# EasyEDA Pro project climbsnail-spotwelder-45c7d2f7.epro, schematic SpotWelder_Mini
Create Date: 2024-03-07; Page Name: P1; Project Name: SpotWelderDev; Schematic Name: SpotWelder_Mini; Update Date: 2024-10-01; Company: 嘉立创EDA; Page Size: A4; Version: V1.0
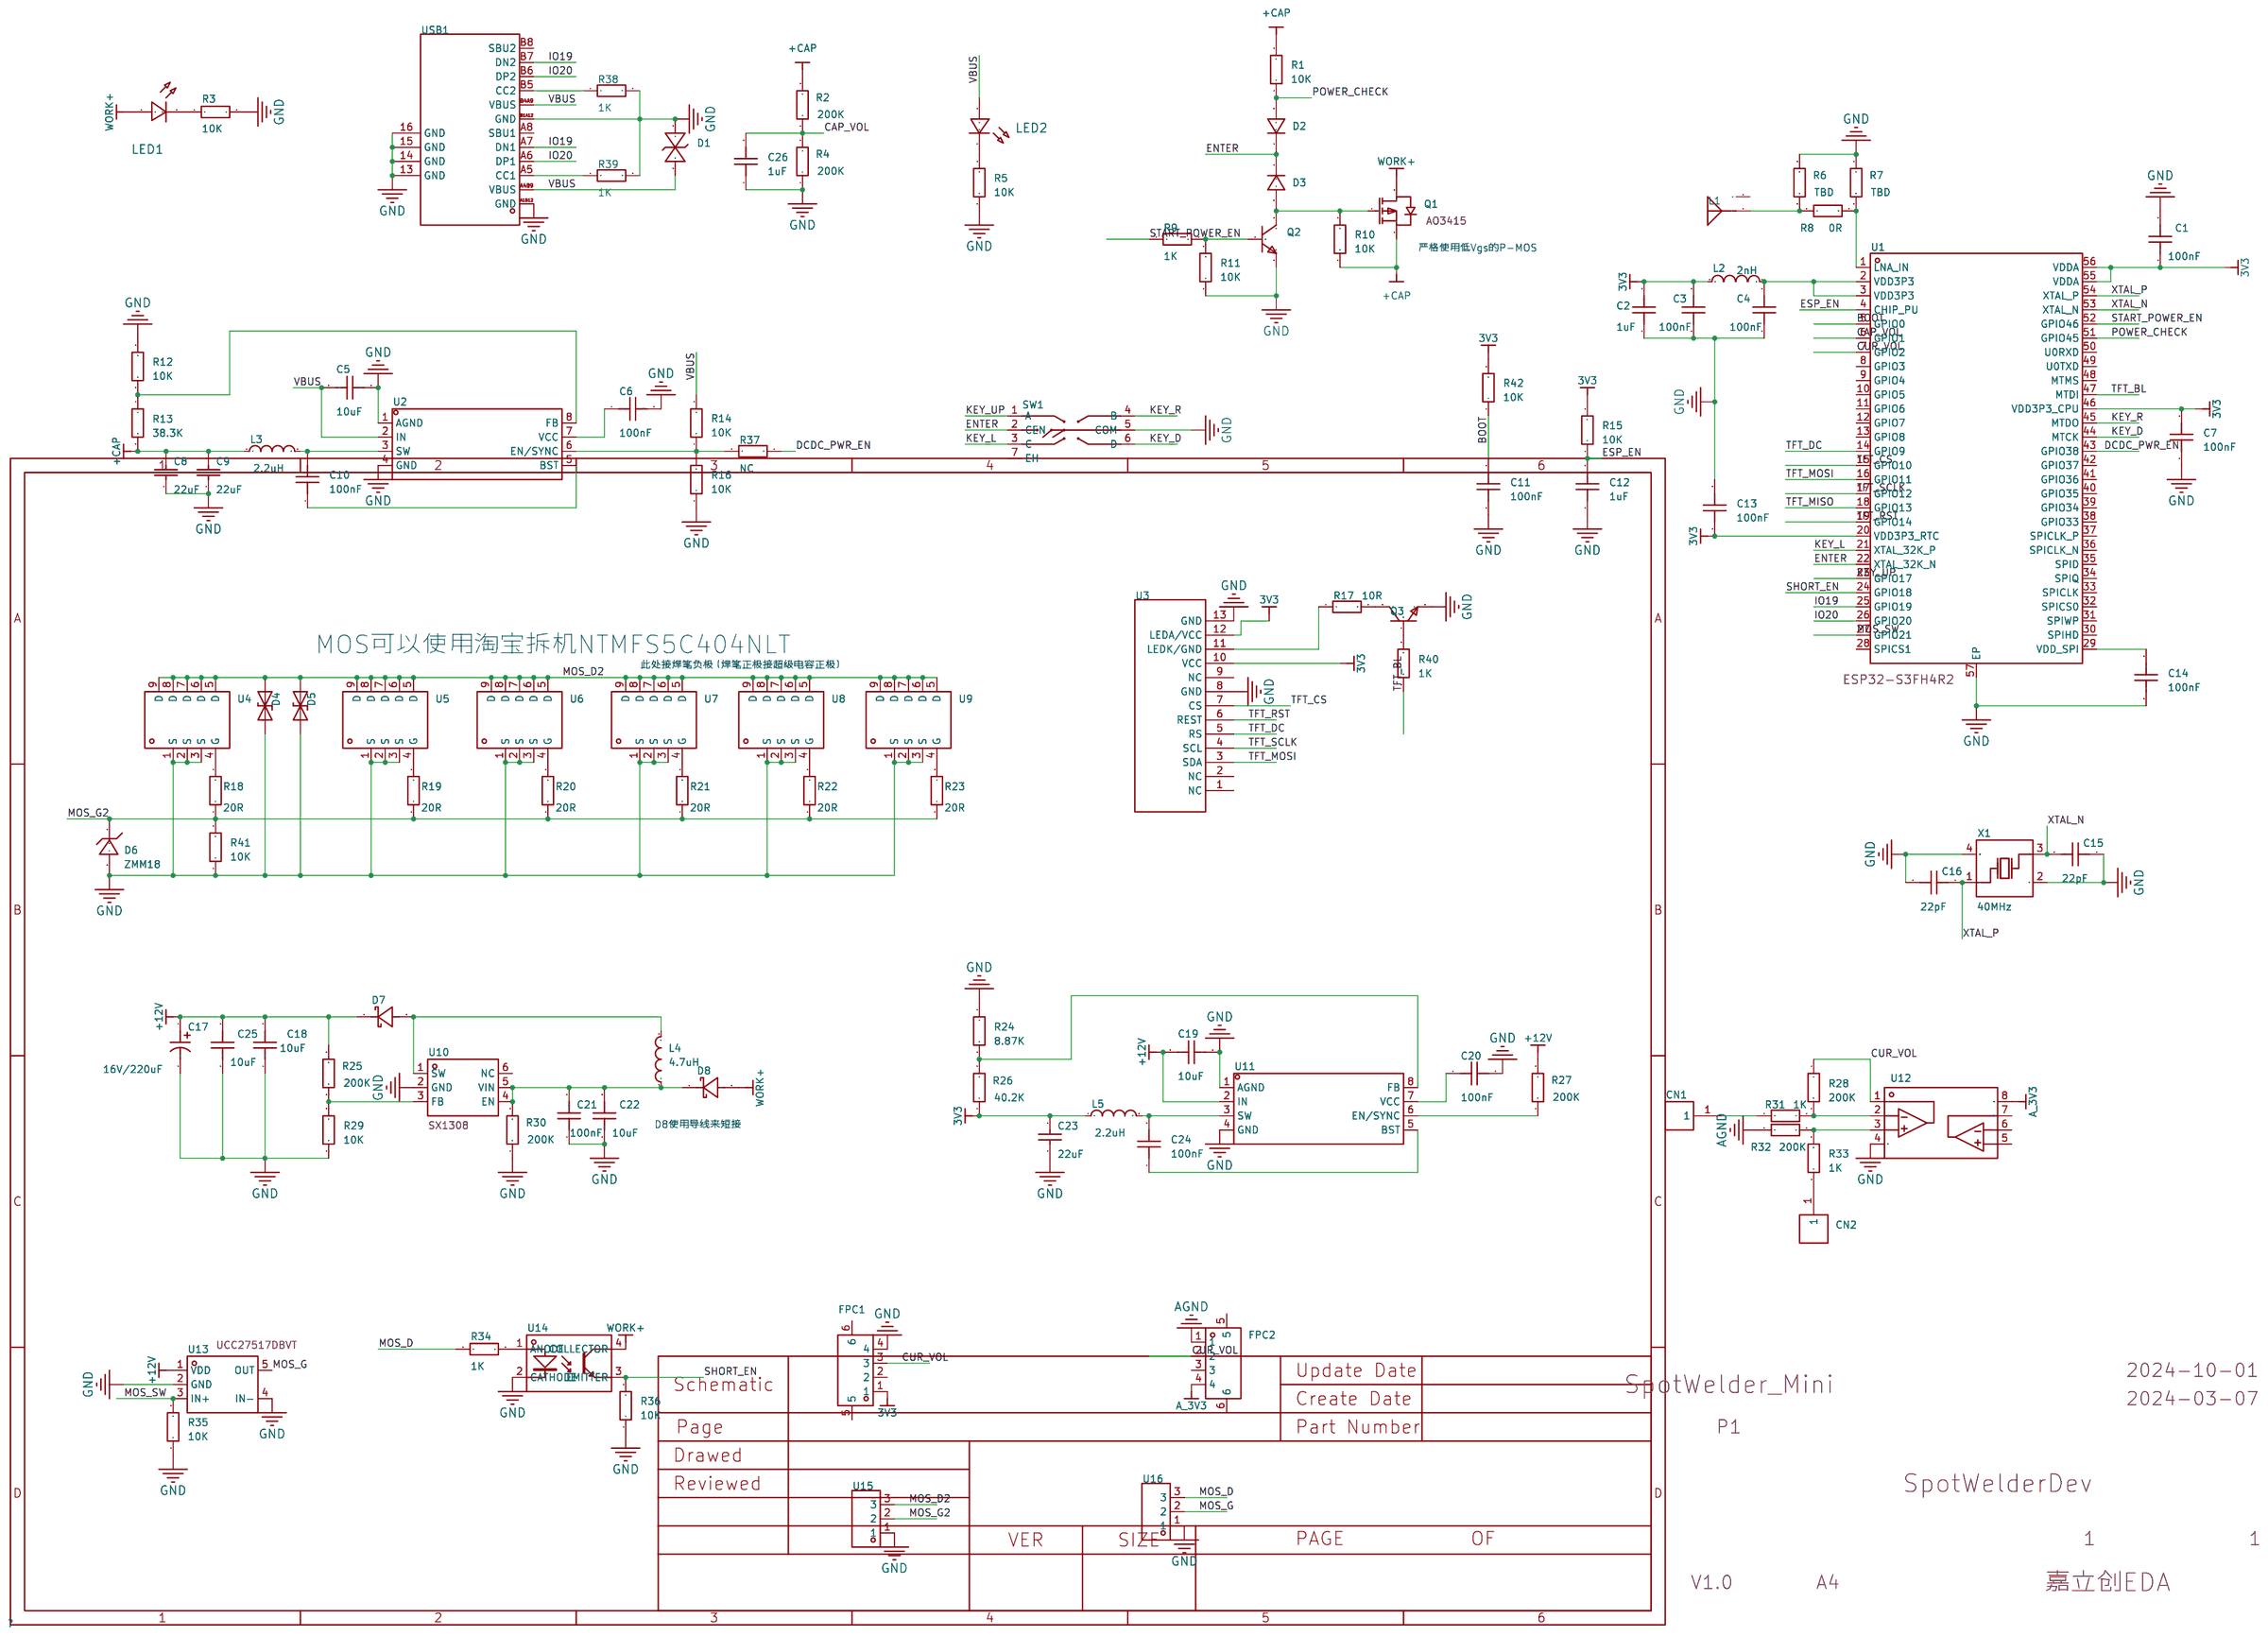
[diagram p0: schematic sheet]

## Parts
C1  100nF  [C0402]
C2  1uF  [C0603]
C3  100nF  [C0402]
C4  100nF  [C0402]
C5  10uF  [C0603]
C6  100nF  [C0402]
C7  100nF  [C0402]
C8  22uF  [C1206]
C9  22uF  [C1206]
C10  100nF  [C0402]
C11  100nF  [C0402]
C12  1uF  [C0402]
C13  100nF  [C0402]
C14  100nF  [C0402]
C15  22pF  [C0603]
C16  22pF  [C0603]
C17  16V/220uF  [CAP-SMD_BD6.3-L6.6-W6.6-FD]
C18  10uF  [C0603]
C19  10uF  [C0603]
C20  100nF  [C0402]
C21  100nF  [C0402]
C22  10uF  [C0603]
C23  22uF  [C1206]
C24  100nF  [C0402]
C25  10uF  [C0603]
C26  1uF  [C0402]
CN1  5006  [TH_BD3.2-D2.0]
CN2  5006  [TH_BD3.2-D2.0]
D1  SMBJ5.0CA  [SMB_L4.6-W3.6-LS5.3-BI]
D2  1N4148WS  [SOD-323_L1.8-W1.3-LS2.5-RD]
D3  1N4148WS  [SOD-323_L1.8-W1.3-LS2.5-RD]
D4  SMBJ28CA双向TVS管  [SMB_L4.6-W3.6-LS5.3-BI]
D5  SMBJ28CA双向TVS管  [SMB_L4.6-W3.6-LS5.3-BI]
D6  ZMM18  [LL-34_L3.5-W1.5-RD]
D7  SS34  [SMA_L4.3-W2.6-LS5.2-RD]
D8  SS34  [SMA_L4.3-W2.6-LS5.2-RD]
FPC1  X05A12H04G  [FPC-SMD_4P-P0.50_XKB_X05A12H04G]
FPC2  X05A12H04G  [FPC-SMD_4P-P0.50_XKB_X05A12H04G]
L1  AN2051-245  [ANT2051]
L2  2nH  [L0402]
L3  2.2uH  [IND-SMD_L4.2-W4.2-C133189]
L4  4.7uH  [IND-SMD_L4.5-W4.0-1]
L5  2.2uH  [IND-SMD_L4.2-W4.2-C133189]
LED1  -  [LED0603-RD_BLUE]
LED2  -  [LED0603-RD_BLUE]
Q1  AO3415  [SOT-23-3_L2.9-W1.3-P1.90-LS2.4-BR]
Q2  S8050 J3Y  [SOT-23-3_L3.0-W1.7-P0.95-LS2.9-BR]
Q3  S8050  [SOT-23-3_L2.9-W1.3-P1.90-LS2.4-BR]
R1  10K  [R0402]
R2  200K  [R0402]
R3  10K  [R0402]
R4  200K  [R0402]
R5  10K  [R0402]
R6  TBD  [R0402]
R7  TBD  [R0402]
R8  0R  [R0402]
R9  1K  [R0603]
R10  10K  [R0402]
R11  10K  [R0402]
R12  10K  [R0402]
R13  38.3K  [R0603]
R14  10K  [R0402]
R15  10K  [R0402]
R16  10K  [R0402]
R17  10R  [R0603]
R18  20R  [R0603]
R19  20R  [R0603]
R20  20R  [R0603]
R21  20R  [R0603]
R22  20R  [R0603]
R23  20R  [R0603]
R24  8.87K  [R0603]
R25  200K  [R0402]
R26  40.2K  [R0402]
R27  200K  [R0402]
R28  200K  [R0402]
R29  10K  [R0402]
R30  200K  [R0402]
R31  1K  [R0603]
R32  200K  [R0402]
R33  1K  [R0603]
R34  1K  [R0603]
R35  10K  [R0402]
R36  10K  [R0402]
R37  NC  [R0402]
R38  1K  [R0603]
R39  1K  [R0603]
R40  1K  [R0603]
R41  10K  [R0402]
R42  10K  [R0402]
SW1  TM-4175-B-A  [SW-SMD_TM-4175-B-X]
U1  ESP32-S3FH4R2  [QFN-56_L7.0-W7.0-P0.40-TL-EP4.0]
U2  -  [TSOT-23-8_L2.9-W1.6-P0.65-LS2.8-BR]
U3  -  [1.14TFT焊接式B]
U4  NCEP30T21GU  [DFN-8_L5.8-W5.1-P1.27-LS5.9-BL]
U5  NCEP30T21GU  [DFN-8_L5.8-W5.1-P1.27-LS5.9-BL]
U6  NCEP30T21GU  [DFN-8_L5.8-W5.1-P1.27-LS5.9-BL]
U7  NCEP30T21GU  [DFN-8_L5.8-W5.1-P1.27-LS5.9-BL]
U8  NCEP30T21GU  [DFN-8_L5.8-W5.1-P1.27-LS5.9-BL]
U9  NCEP30T21GU  [DFN-8_L5.8-W5.1-P1.27-LS5.9-BL]
U10  SX1308  [SOT-23-6_L2.9-W1.6-P0.95-LS2.8-BR]
U11  -  [TSOT-23-8_L2.9-W1.6-P0.65-LS2.8-BR]
U12  GS8332-SR  [SOP-8_L4.9-W3.9-P1.27-LS6.0-BL]
U13  UCC27517DBVT  [SOT-23-5_L2.9-W1.6-P0.95-LS2.8-BR]
U14  CT185GB(T1)  [SOP-4_L4.4-W3.6-P2.54-LS7.0-TL]
U15  A2541WV-3P  [HDR-TH_3P-P2.54-V-M]
U16  A2541WV-3P  [HDR-TH_3P-P2.54-V-M]
USB1  TYPEC-304-BCP16  [USB-C-SMD_TYPEC-304-BCP16]
X1  40MHz  [OSC-SMD_4P-L3.2-W2.5-BL_SIT8008BI]

## Library data of the parts
C1 C3 C4 C6 C7 C10-C14 C20 C21 C24 C26 = CAP_0402: Supplier Footprint: 0402
C2 C5 C15 C16 C18 C19 C22 C25 = CAP_0603: 容值:100nF;精度:±10%;额定电压:50V;温度系数:X7R;; Supplier Footprint: 0603
C8 C9 C23 = CL31A226KAHNNNE: 容值:22uF;精度:±10%;额定电压:25V;材质(温度系数):X5R;; LCSC Part Name: 22uF ±10% 25V; Supplier Part: C12891; Manufacturer: SAMSUNG(三星); Supplier Footprint: 1206; JLCPCB Part Class: Basic Part; Datasheet: https://atta.szlcsc.com/upload/public/pdf/source/20160103/1457707667836.pdf; Supplier: LCSC; Tolerance: ±10%; Voltage Rated: 25V; Temperature Coefficient: X5R
C17 = RVT220UF10V67RV0037: 容值:220uF;额定电压:10V;电容体直径:-;电容体长度:-;纹波电流:-;等效串联电阻:-;工作寿命:2000hrs@105℃;; LCSC Part Name: 220uF 10V; Supplier Part: C2833309; Manufacturer: KNSCHA(科尼盛); Supplier Footprint: SMD,6.3x5.4mm; JLCPCB Part Class: 扩展库; Datasheet: https://atta.szlcsc.com/upload/public/pdf/source/20210521/C2833309_008BCE4BC4FC60DA08096FEE6338ABBD.pdf; Supplier: LCSC; Rated Voltage: 10V; Lifetime @ Temp: 2000hrs@105℃
CN1 CN2 = 5006_C2906764: 测试点; Supplier Part: C2906764; Manufacturer: Keystone; JLCPCB Part Class: 扩展库; Datasheet: https://atta.szlcsc.com/upload/public/pdf/source/20211115/64B944F8418AA2CF0680BB1B201435FB.pdf; Supplier: LCSC
D1 = SMBJ5.0CA_C726851: Supplier Part: C726851; Manufacturer: TWGMC(台湾迪嘉); Supplier Footprint: SMB; JLCPCB Part Class: 扩展库; Datasheet: https://atta.szlcsc.com/upload/public/pdf/source/20200901/C726811_07201DC3516E92FF13903A0BAE18F725.pdf; Supplier: LCSC
D2 D3 = 1N4148WS_C2128: 二极管配置:独立式;功率:200mW;直流反向耐压(Vr):100V;平均整流电流(Io):150mA;正向压降(Vf):1.25V@150mA;反向电流(Ir):1uA@75V;反向恢复时间(trr):4ns;工作温度:+150℃@(Tj);; LCSC Part Name: 100V 150mA 4ns T4; Supplier Part: C2128; Manufacturer: CJ(江苏长电/长晶); Supplier Footprint: SOD-323; JLCPCB Part Class: 基础库; Datasheet: https://atta.szlcsc.com/upload/public/pdf/source/20140809/1457707208178.pdf; Supplier: LCSC; Diode Configuration: 独立式; Power Dissipation: 200mW; Reverse Voltage (Vr): 100V; Average Rectified Current (Io): 150mA; Forward Voltage (Vf@If): 1.25V@150mA; Reverse Leakage Current: 1uA@75V; Reverse Recovery Time (trr): 4ns; Operating Temperature: +150℃@(Tj)
D4 D5 = SMBJ28CA双向TVS管: Pin Type: IN; Supplier: LCSC; Manufacturer Part: SMBJ28CA; Manufacturer: Brightking; Supplier Part: C78417; JLCPCB Part Class: Extended Part
D6 = ZMM18: 二极管配置:独立式;稳压值(标称值):18V;稳压值(范围):16.8V~19.1V;精度:-;功率:500mW;反向电流(Ir):100nA@13V;阻抗(Zzt):50Ω;; LCSC Part Name: 18V 500mW; Supplier Part: C8071; Manufacturer: ST(先科); Supplier Footprint: LL-34; JLCPCB Part Class: Extended Part; Datasheet: https://atta.szlcsc.com/upload/public/pdf/source/20120512/1457706507902.pdf; Supplier: LCSC; Diode Configuration: 独立式; Zener Voltage (Nom): 18V; Zener Voltage (Range): 16.8V~19.1V; Power Dissipation: 500mW; Reverse Leakage Current (Ir): 100nA@13V; Zener Impedance (Zzt): 50Ω
D7 D8 = SS34_C3032484: Supplier Part: C3032484; Manufacturer: TDD(台冠电子); Supplier Footprint: SMA; JLCPCB Part Class: Extended Part; Datasheet: https://atta.szlcsc.com/upload/public/pdf/source/20220622/9D70D0693761B542BF6F533590093AA5.pdf; Supplier: LCSC
FPC1 FPC2 = X05A12H04G: 间距:0.5mm;触点数量:4;锁定特性:翻盖式;安装类型:卧贴;触点类型:双侧触点/上下接;工作温度范围:-40℃~+85℃;焊接温度(最大值):260℃;; LCSC Part Name: 0.5mm P数:4 翻盖式 双侧触点/上下接; Supplier Part: C2880761; Manufacturer: XKB Connectivity(中国星坤); Supplier Footprint: SMD,P=0.5mm; Datasheet: https://atta.szlcsc.com/upload/public/pdf/source/20211011/7594ED4A8B21B39D6C2C07571E80F84E.pdf; Supplier: LCSC; Pitch: 0.5mm; Number of Contacts: 4; Locking Feature: 翻盖式; Mounting Type: 卧贴; Contact Type: 双侧触点/上下接; Height Above Board: 1.2mm; FFC, FCB Thickness: 0.3mm; Contact Material: 磷青铜; Contact Plating: 金; Operating Temperature Range: -40℃~+85℃; Welding Temperature (Max): 260℃
L1 = AN2051-245: 小体积，高增益，WIFI，蓝牙，zigBee 2.4G天线; Supplier Part: C99727; Manufacturer: rainsun(霖昱微); Supplier Footprint: 2051; JLCPCB Part Class: 扩展库; Datasheet: https://atta.szlcsc.com/upload/public/pdf/source/20170329/1490752053541.pdf; Supplier: LCSC
L2 = LQG15HS2N0S02D: 电感值:2nH;精度:±0.3nH;额定电流:900mA;饱和电流(Isat):-;直流电阻(DCR):90mΩ;; LCSC Part Name: 2nH ±0.3nH 90mΩ; Supplier Part: C18216; Manufacturer: muRata(村田); Supplier Footprint: 0402; JLCPCB Part Class: 扩展库; Datasheet: https://atta.szlcsc.com/upload/public/pdf/source/20190514/C18216_4C6D770518CF7A3B206943E09D2940CE.pdf; Supplier: LCSC; Tolerance: ±0.3nH; Rated Current: 900mA; DC Resistance (DCR): 90mΩ; Q @ Freq: 8@100MHz; Frequency - Self Resonant: 6GHz
L3 L5 = HA42-2R2MT: 电感值:2.2uH;精度:±20%;额定电流:3A;饱和电流(Isat):5A;直流电阻(DCR):58mΩ;; LCSC Part Name: 2.2uH ±20% 3A 58mΩ; Supplier Part: C2936650; Manufacturer: FH(风华); Supplier Footprint: 0420; JLCPCB Part Class: 扩展库; Datasheet: https://atta.szlcsc.com/upload/public/pdf/source/20211228/DF5AAD1C624D1DACD739A51BD94418BC.pdf; Supplier: LCSC; Tolerance: ±20%; Rated Current: 3A; Saturation Current (Isat): 5A; DC Resistance (DCR): 58mΩ
L4 = MCS0420-4R7MPN2: 电感值:4.7uH;精度:±20%;额定电流:2.2A;饱和电流(Isat):3.5A;直流电阻(DCR):98mΩ;; LCSC Part Name: 4.7uH ±20% 2.2A 98mΩ; Supplier Part: C2937092; Manufacturer: PSA(信昌电陶); Supplier Footprint: 0420; JLCPCB Part Class: Extended Part; Datasheet: https://atta.szlcsc.com/upload/public/pdf/source/20220121/BD01ABADD177E465ADC6F87339B1CE90.pdf; Supplier: LCSC; Tolerance: ±20%; Rated Current: 2.2A; Saturation Current (Isat): 3.5A; DC Resistance (DCR): 98mΩ
LED1 LED2 = LED_0603-R: 发光颜色:红灯;二极管配置:-;透镜颜色:无色透明;主波长:617.5nm;峰值波长:632nm;色温:-;光通量(25时):-;测试电流:5mA;正向电压(VF):2.2V;发光强度:28.5mcd;功率:60mW;发光角度:120°;安装方式:-;工作温度:-40~+85;; Supplier Footprint: 0603; Supplier Part: C72044
Q1 = AO3415_C181094: 类型:P沟道;漏源电压(Vdss):20V;连续漏极电流(Id):4A;功率(Pd):1.5W;导通电阻(RDS(on)@Vgs,Id):41mΩ@4.5V,4A;阈值电压(Vgs(th)@Id):900mV@250uA;; LCSC Part Name: P沟道 20V 4A; Supplier Part: C181094; Manufacturer: Hottech(合科泰); Supplier Footprint: SOT-23; JLCPCB Part Class: Extended Part; Datasheet: https://atta.szlcsc.com/upload/public/pdf/source/20180131/C181094_15173931965481329223.pdf; Supplier: LCSC; Type: P沟道; Drain Source Voltage (Vdss): 20V; Continuous Drain Current (Id): 4A; Power Dissipation (Pd): 1.5W; Drain Source On Resistance (RDS(on)@Vgs,Id): 41mΩ@4.5V,4A; Gate Threshold Voltage (Vgs(th)@Id): 900mV@250uA
Q2 = S8050 J3Y_C2146: 晶体管类型:NPN;集射极击穿电压(Vceo):25V;集电极电流(Ic):500mA;功率(Pd):300mW;集电极截止电流(Icbo):100nA;集电极-发射极饱和电压(VCE(sat)@Ic,Ib):600mV@500mA,50mA;直流电流增益(hFE@Ic,Vce):200@50mA,1V;特征频率(fT):150MHz;工作温度:+150℃@(Tj);; LCSC Part Name: NPN 25V 500mA (200-350); Supplier Part: C2146; Manufacturer: CJ(江苏长电/长晶); Supplier Footprint: SOT-23-3L; JLCPCB Part Class: 基础库; Datasheet: https://atta.szlcsc.com/upload/public/pdf/source/20140809/1457707209234.pdf; Supplier: LCSC; Transistor Type: NPN; Collector-Emitter Breakdown Voltage (Vceo): 25V; Collector Current (Ic): 500mA; Power Dissipation (Pd): 300mW; Collector Cut-Off Current (Icbo): 100nA; Collector-Emitter Saturation Voltage (VCE(sat)@Ic,Ib): 600mV@500mA,50mA; DC Current Gain (hFE@Ic,Vce): 200@50mA,1V; Transition Frequency (fT): 150MHz; Operating Temperature: +150℃@(Tj)
Q3 = S8050_C2891804: Supplier Part: C2891804; Manufacturer: YONGYUTAI(永裕泰); Supplier Footprint: SOT-23; JLCPCB Part Class: 扩展库; Datasheet: https://atta.szlcsc.com/upload/public/pdf/source/20210901/5347316A10609C628D4D69AE01446E5B.pdf; Supplier: LCSC
R1-R8 R10-R12 R14-R16 R25-R30 R32 R35-R37 R41 R42 = Res_0402: Supplier Footprint: 0402
R9 R13 R17-R24 R31 R33 R34 R38-R40 = Res_0603: Supplier Footprint: 0603
SW1 = TM-4175-B-A: 多功能开关 7.5*7.5*5 五向开关 H5; LCSC Part Name: 多功能开关 7.5*7.5*5 五向开关 H5; Supplier Part: C465995; Manufacturer: XKB Connectivity(中国星坤); Supplier Footprint: SMD-8P,7.5x7.5mm; JLCPCB Part Class: 扩展库; Datasheet: https://atta.szlcsc.com/upload/public/pdf/source/20211011/A0F6117F2AB0E02F6CF3847B7456F266.pdf; Supplier: LCSC
U1 = ESP32-S3: Supplier Part: C2913192; Manufacturer: ESPRESSIF(乐鑫); Supplier Footprint: QFN-56-EP(7x7); JLCPCB Part Class: 扩展库; Datasheet: https://atta.szlcsc.com/upload/public/pdf/source/20220211/8CA5C1C53CA8E3D1871752073201D38A.pdf; Supplier: LCSC
U2 U11 = MP2225GJ-Z: 最大输入电压:-;可输出电流:-;; Supplier Part: C133066; Supplier Footprint: TSOT-23-8; JLCPCB Part Class: 扩展库; Supplier: LCSC
U3 = 1.14TFT焊接式: Supplier: LCSC; Supplier Part: 1.14寸LCD; link: https://item.taobao.com/item.htm?spm=a1z09.2.0.0.71822e8drxlmENid=586638527978_u=v83q7ore291; Manufacturer: 中景园; Manufacturer Part: 1.14寸LCD
U4-U9 = NCEP30T21GU: Supplier Part: C502971; Manufacturer: NCE(无锡新洁能); Supplier Footprint: DFN5x6Clip-A; Supplier: LCSC
U10 = SX1308: 功能类型:升压型;同步整流:否;输出通道数:1;拓扑结构:升压式;输入电压:2V~24V;输出电压:28V;输出电流(最大值):-;开关频率:1.2MHz;; LCSC Part Name: 升压型 Vin=2V~24V Vout=28V; Supplier Part: C78162; Manufacturer: SX(硕芯科技); Supplier Footprint: SOT-23-6; JLCPCB Part Class: Extended Part; Datasheet: https://atta.szlcsc.com/upload/public/pdf/source/20160920/1474356679185.pdf; Supplier: LCSC; Function: 升压型; Synchronous Rectification: 否; Number of Outputs: 1; Topology: 升压式; Input Voltage: 2V~24V; Output Voltage: 28V; Switching Frequency: 1.2MHz
U12 = GS8332-SR: 运放类型:Zero-Drift;放大器组数:2;增益带宽积（GBP）:350KHz;压摆率（SR）:0.2 V/us;电源电压:2.1V ~ 5.5V;各通道供电电流:20uA;; LCSC Part Name: GS8332 SOP-8; Supplier Part: C157713; Manufacturer: Gainsil(聚洵); Supplier Footprint: SOP-8-150mil; JLCPCB Part Class: 扩展库; Datasheet: https://atta.szlcsc.com/upload/public/pdf/source/20200615/C605419_D70E1851DA800D34ADA08E397521FED7.pdf; Supplier: LCSC; Amplifier Type: Zero-Drift; Number of Circuits: 2; Gain Bandwidth Product（GBP）: 350KHz; Slew Rate（SR）: 0.2 V/us; Output Type: Rail-to-Rail; Supply Voltage（Single）: 2.1V ~ 5.5V; Iq per channel (Typ): 20uA; Operating Temperature: -40°C ~ 125°C
U13 = UCC27517DBVT: 采用 SOT-23 封装、具有 5V UVLO 和 13ns 传播延迟的 4A/4A 单通道栅极驱动器 5-SOT-23 -40 to 140; Supplier Part: C2877770; Manufacturer: TI(德州仪器); Supplier Footprint: SOT-23-5; JLCPCB Part Class: Extended Part; Supplier: LCSC
U14 = CT185GB(T1): 输入电压类型:DC;输出通道数:1;正向电压:1.24V;反向电压:6V;输出电流:50mA;接收端电压:80V;集射极饱和电压(Vce(sat)@Ic,IF):300mV@2.4mA,8mA;隔离电压(rms):3.75kV;; LCSC Part Name: DC输入 隔离电压(rms):3750V; Supplier Part: C191836; Manufacturer: CT MICRO; Supplier Footprint: SOP-4-2.54mm; JLCPCB Part Class: Extended Part; Datasheet: https://atta.szlcsc.com/upload/public/pdf/source/20180504/C191836_4B58AF92622DBE42072B31496F4BAFB3.pdf; Supplier: LCSC; Input voltage type: DC; Output Type: 光电三极管; Number of Outputs: 1; Forward Voltage: 1.24V; Reverse Voltage: 6V; Output Current: 50mA; Receiving End Voltage: 80V; Collector-Emitter Saturation Voltage (Vce(sat)@Ic,IF): 300mV@2.4mA,8mA; Rise time: 5us@2mA,100Ω; Fall time: 9us@2mA,100Ω; Isolation Voltage(rms): 3.75kV; Operating Temperature: -55℃~+110℃; Pin Name: COLLECTOR
U15 U16 = A2541WV-3P_1: Supplier Part: C5295980; Manufacturer: CJT(长江连接器); Supplier Footprint: 插件,P=2.54mm; Datasheet: https://atta.szlcsc.com/upload/public/pdf/source/20190522/C339348_148DC62DFEE35B66DE27661541078F4A.pdf; Supplier: LCSC
USB1 = TYPEC-304-BCP16_C720629: 连接器类型:Type-C;标准:USB 3.1;公母:母座;触点数量:16;端口数量:1;安装方式:卧贴;额定电流 - 电源:3A;工作温度范围:-25~+85;焊接温度(最大值):260;; LCSC Part Name: Type-C 母座 卧贴 停产 停产; Supplier Part: C720629; Manufacturer: XUNPU(讯普); Supplier Footprint: SMD; JLCPCB Part Class: Extended Part; Datasheet: https://atta.szlcsc.com/upload/public/pdf/source/20220210/1FE0FEFF7D6A20C111212527D3DED014.pdf; Supplier: LCSC; Connector Type: Type-C; Standard: USB 3.1; Gender: 母座; Number of Contacts: 16; Number of Ports: 1; Mounting Style: 卧贴; Current Rating - Power (Max): 3A; Operating Temperature Range: -25~+85; Welding Temperature (Max): 260
X1 = X322540MPB4SI: 晶振类型:贴片无源晶振;频率:40MHz;频率公差:±10ppm;频率稳定度:±30ppm;负载电容:15pF;工作温度:-40℃~+85℃;; LCSC Part Name: 40MHz ±10ppm 15pF; Supplier Part: C9010; Manufacturer: YXC扬兴科技; Supplier Footprint: SMD3225-4P; JLCPCB Part Class: 扩展库; Datasheet: https://atta.szlcsc.com/upload/public/pdf/source/20210329/C112971_1F611BDC486E193C1706F6D8EB5AA189.pdf; Supplier: LCSC; Crystal Type: 贴片无源晶振; Frequency Tolerance: ±10ppm; Frequency Stability: ±30ppm; Load Capacitance: 15pF; Operating Temperature: -40℃~+85℃

## Nets
3V3: C1.1 C2.2 C3.2 C7.2 C13.1 C23.2 FPC1.1 L2.1 L5.1 R15.2 R26.1 R42.2 U1.20(VDD3P3_RTC) U1.46(VDD3P3_CPU) U1.55(VDDA) U1.56(VDDA) U3.10(VCC) U3.12(LEDA/VCC)
+12V: C17.1 C18.2 C19.2 C25.2 D7.1(K) R25.2 R27.2 U11.2(IN) U13.1(VDD)
AGND: FPC2.1 R32.2
GND: C1.2 C2.1 C3.1 C4.1 C5.1 C6.2 C7.1 C8.1 C9.1 C11.1 C12.1 C13.2 C14.1 C15.1 C16.2 C17.2 C18.1 C19.1 C20.2 C21.1 C22.1 C23.1 C25.1 C26.1 D1.2 D4.2(A) D5.2(A) D6.2(A) FPC1.4 Q2.2(E) Q3.2(E) R3.2 R4.1 R5.1 R6.1 R7.1 R11.1 R12.2 R16.1 R24.1 R29.1 R30.1 R35.1 R36.1 R38.2 R39.2 R41.1 SW1.5(COM) U1.57(EP) U2.1(AGND) U2.4(GND) U3.8(GND) U3.13(GND) U4.1(S) U4.2(S) U4.3(S) U5.1(S) U5.2(S) U5.3(S) U6.1(S) U6.2(S) U6.3(S) U7.1(S) U7.2(S) U7.3(S) U8.1(S) U8.2(S) U8.3(S) U9.1(S) U9.2(S) U9.3(S) U10.2(GND) U11.1(AGND) U11.4(GND) U12.4(VSS) U13.2(GND) U13.4(IN-) U14.2(CATHODE) U15.1 U16.1 USB1.13(GND) USB1.14(GND) USB1.15(GND) USB1.16(GND) USB1.A1B12(GND) USB1.B1A12(GND) X1.2(GND) X1.4(GND)
VBUS: C5.2 D1.1 LED2.2(A) R14.2 U2.2(IN) USB1.A4B9(VBUS) USB1.B4A9(VBUS)
+CAP: C8.2 C9.2 L3.1 Q1.2(S) R1.2 R2.2 R10.1 R13.2
A_3V3: FPC2.4 U12.8(VDD)
BOOT: C11.2 R42.1 U1.5(GPIO0)
CAP_VOL: C26.2 R2.1 R4.2 U1.6(GPIO1)
CUR_VOL: FPC1.3 FPC2.2 R28.1 U1.7(GPIO2) U12.1(OUTA)
DCDC_PWR_EN: R37.1 U1.43(GPIO38)
ENTER: D2.1(K) D3.1(K) SW1.2(CEN) U1.22(XTAL_32K_N)
ESP_EN: C12.2 R15.1 U1.4(CHIP_PU)
IO19: U1.25(GPIO19) USB1.A7(DN1) USB1.B7(DN2)
IO20: U1.26(GPIO20) USB1.A6(DP1) USB1.B6(DP2)
KEY_D: SW1.6(D) U1.44(MTCK)
KEY_L: SW1.3(C) U1.21(XTAL_32K_P)
KEY_R: SW1.4(B) U1.45(MTDO)
KEY_UP: SW1.1(A) U1.23(GPIO17)
MOS_D: R34.1 U16.3
MOS_D2: D4.1(K) D5.1(K) U4.5(D) U4.6(D) U4.7(D) U4.8(D) U4.9(D) U5.5(D) U5.6(D) U5.7(D) U5.8(D) U5.9(D) U6.5(D) U6.6(D) U6.7(D) U6.8(D) U6.9(D) U7.5(D) U7.6(D) U7.7(D) U7.8(D) U7.9(D) U8.5(D) U8.6(D) U8.7(D) U8.8(D) U8.9(D) U9.5(D) U9.6(D) U9.7(D) U9.8(D) U9.9(D) U15.3
MOS_G: U13.5(OUT) U16.2
MOS_G2: D6.1(C) R18.1 R19.1 R20.1 R21.1 R22.1 R23.1 R41.2 U15.2
MOS_SW: R35.2 U1.27(GPIO21) U13.3(IN+)
POWER_CHECK: D2.2(A) R1.1 U1.51(GPIO45)
SHORT_EN: R36.2 U1.24(GPIO18) U14.3(EMITTER)
START_POWER_EN: R9.1 U1.52(GPIO46)
TFT_BL: R40.2 U1.47(MTDI)
TFT_CS: U1.15(GPIO10) U3.7(CS)
TFT_DC: U1.14(GPIO9) U3.5(RS)
TFT_MISO: U1.18(GPIO13)
TFT_MOSI: U1.16(GPIO11) U3.3(SDA)
TFT_RST: U1.19(GPIO14) U3.6(REST)
TFT_SCLK: U1.17(GPIO12) U3.4(SCL)
WORK+: D8.2(A) LED1.2(A) Q1.3(D) U14.4(COLLECTOR)
XTAL_N: C15.2 U1.53(XTAL_N) X1.3(OSC2)
XTAL_P: C16.1 U1.54(XTAL_P) X1.1(OSC1)
$1N280: D7.2(A) L4.2 U10.1(SW)
$1N506: R25.1 R29.2 U10.3(FB)
$1N673: C21.2 C22.2 D8.1(K) L4.1 R30.2 U10.4(EN) U10.5(VIN)
$1N69310: R18.2 U4.4(G)
$1N69428: R19.2 U5.4(G)
$1N69546: R20.2 U6.4(G)
$1N69664: R21.2 U7.4(G)
$1N69782: R22.2 U8.4(G)
$1N73187: R23.2 U9.4(G)
$1N80208: C10.2 L3.2 U2.3(SW)
$1N83125: C10.1 U2.5(BST)
$1N83932: C6.1 U2.7(VCC)
$1N85156: R12.1 R13.1 U2.8(FB)
$1N86985: C24.2 L5.2 U11.3(SW)
$1N86986: C24.1 U11.5(BST)
$1N86989: R27.1 U11.6(EN/SYNC)
$1N86990: C20.1 U11.7(VCC)
$1N86995: R24.2 R26.2 U11.8(FB)
$1N89886: D3.2(A) Q1.1(G) Q2.3(C) R10.2
$1N90159: Q2.1(B) R9.2 R11.2
$1N102735: C4.2 L2.2 U1.2(VDD3P3) U1.3(VDD3P3)
$1N104052: C14.2 U1.29(VDD_SPI)
$1N111735: R7.2 R8.2 U1.1(LNA_IN)
$1N112405: L1.1(ANT) R6.2 R8.1
$1N115607: LED1.1(C) R3.1
$1N115916: LED2.1(C) R5.2
$1N135994: R32.1 R33.2 U12.3(INA+)
$1N136281: R28.2 R31.1 U12.2(INA-)
$1N154799: R34.2 U14.1(ANODE)
$1N157330: CN1.1 R31.2
$1N158078: CN2.1 R33.1
$1N164036: R14.1 R16.2 R37.2 U2.6(EN/SYNC)
$1N177745: R38.1 USB1.B5(CC2)
$1N177900: R39.1 USB1.A5(CC1)
$1N182596: Q3.3(C) R17.2
$1N183266: R17.1 U3.11(LEDK/GND)
$1N186675: Q3.1(B) R40.1

Not connected (* = marked no-connect by the designer): FPC1 2 5 6; FPC2 3 5 6; L1 2; SW1 7(EH); U1 8(GPIO3) 9(GPIO4) 10(GPIO5) 11(GPIO6) 12(GPIO7) 13(GPIO8) 28(SPICS1) 30(SPIHD) 31(SPIWP) 32(SPICS0) 33(SPICLK) 34(SPIQ) 35(SPID) 36(SPICLK_N) 37(SPICLK_P) 38(GPIO33) 39(GPIO34) 40(GPIO35) 41(GPIO36) 42(GPIO37) 48(MTMS) 49(U0TXD) 50(U0RXD); U3 1(NC) 2(NC) 9(NC); U10 6(NC); U12 5(INB+) 6(INB-) 7(OUTB); USB1 A8(SBU1) B8(SBU2)

## Notes on the sheet
- 严格使用低Vgs的P-MOS
- MOS可以使用淘宝拆机NTMFS5C404NLT
- 此处接焊笔负极（焊笔正极接超级电容正极）
- D8使用导线来短接
